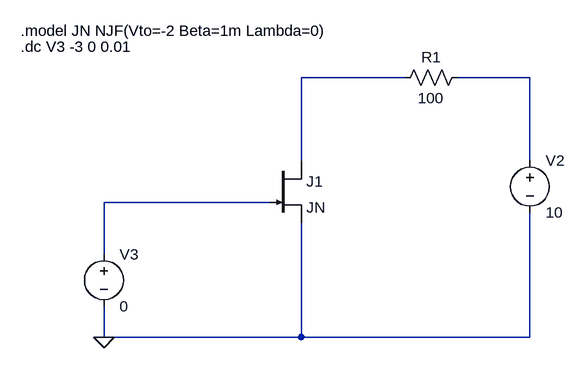
[diagram p0: schematic Ex01.asc]
Ex01.asc, the LTspice schematic file:
Version 4.1
SHEET 1 880 680
WIRE 336 -16 176 -16
WIRE 528 -16 416 -16
WIRE 176 112 176 -16
WIRE 528 112 528 -16
WIRE 128 176 -128 176
WIRE -128 256 -128 176
WIRE -128 384 -128 336
WIRE 176 384 176 208
WIRE 176 384 -128 384
WIRE 528 384 528 192
WIRE 528 384 176 384
FLAG -128 384 0
SYMBOL njf 128 112 R0
SYMATTR InstName J1
SYMATTR Value JN
SYMBOL voltage 528 96 R0
SYMATTR InstName V2
SYMATTR Value 10
SYMBOL voltage -128 240 R0
SYMATTR InstName V3
SYMATTR Value 0
SYMBOL res 432 -32 R90
WINDOW 0 0 56 VBottom 2
WINDOW 3 32 56 VTop 2
SYMATTR InstName R1
SYMATTR Value 100
TEXT -256 -88 Left 2 !.model JN NJF(Vto=-2 Beta=1m Lambda=0)
TEXT -256 -64 Left 2 !.dc V3 -3 0 0.01

The netlist it stands for:
* Ex01.asc
J1 N001 N003 0 JN
V2 N002 0 10
V3 N003 0 0
R1 N002 N001 100
.model NJF NJF
.model PJF PJF
.lib standard.jft
.model JN NJF(Vto=-2 Beta=1m Lambda=0)
.dc V3 -3 0 0.01
.backanno
.end